# Altium schematic sheet Daughter_Card_Connectors.SchDoc
size A; SheetNumber: 7; SheetTotal: 7
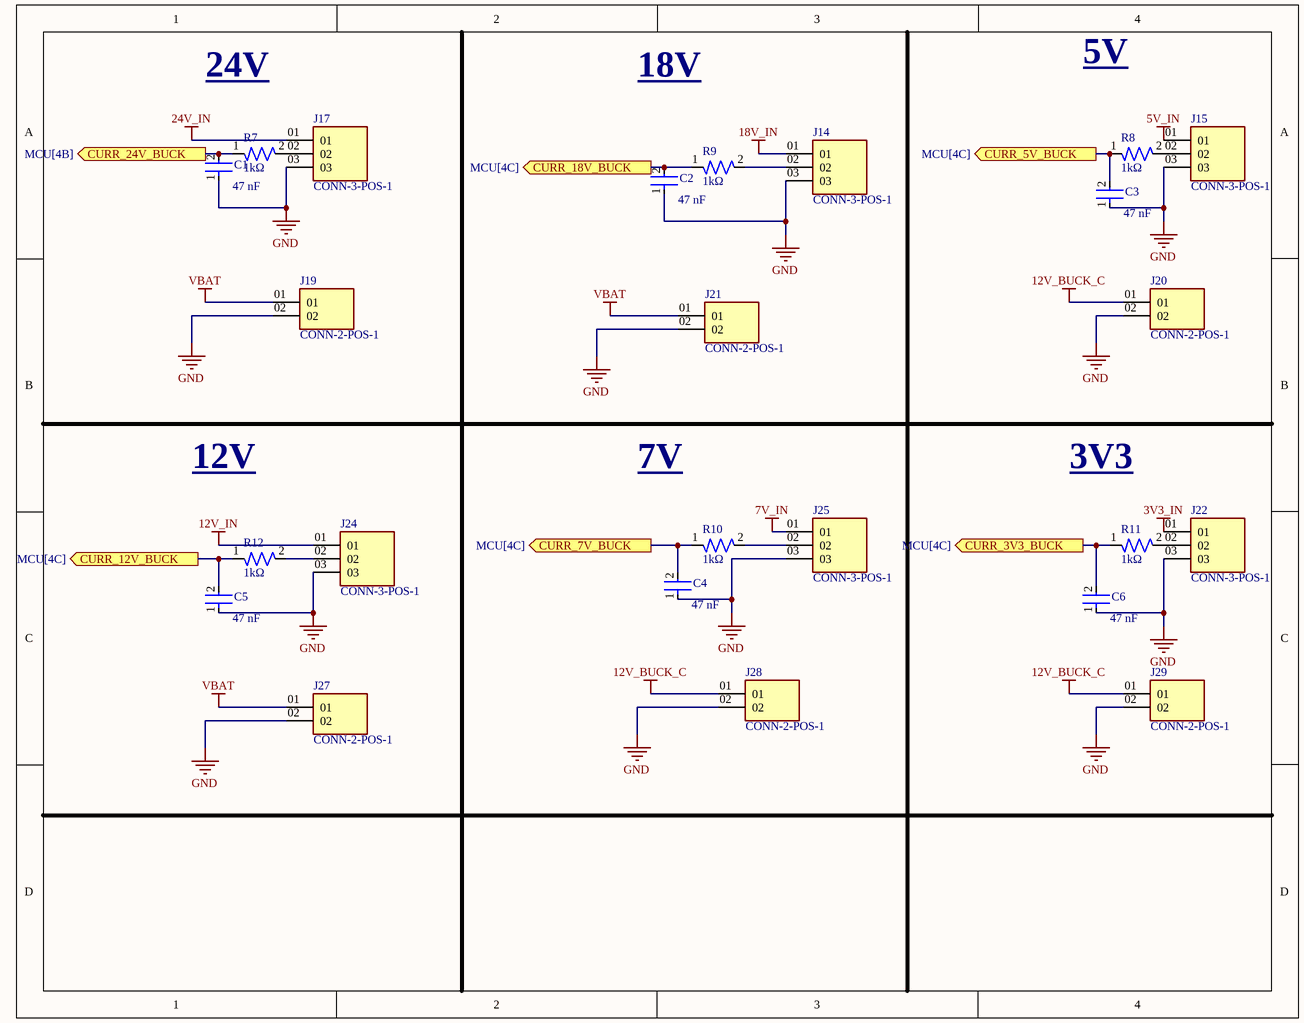
[diagram p0: Daughter_Card_Connectors.SchDoc]

## Parts
C1  Capacitance: 47 nF  [CAP-0603]  (hidden comment: GRM1885C1H302JA01D)
C2  Capacitance: 47 nF  [CAP-0603]  (hidden comment: GRM1885C1H302JA01D)
C3  Capacitance: 47 nF  [CAP-0603]  (hidden comment: GRM1885C1H302JA01D)
C4  Capacitance: 47 nF  [CAP-0603]  (hidden comment: GRM1885C1H302JA01D)
C5  Capacitance: 47 nF  [CAP-0603]  (hidden comment: GRM1885C1H302JA01D)
C6  Capacitance: 47 nF  [CAP-0603]  (hidden comment: GRM1885C1H302JA01D)
J14  CONN-3-POS-1  [SAMTEC_UMPS-03-03.5-L-V-S-W-TR]
J15  CONN-3-POS-1  [SAMTEC_UMPS-03-03.5-L-V-S-W-TR]
J17  CONN-3-POS-1  [SAMTEC_UMPS-03-03.5-L-V-S-W-TR]
J19  CONN-2-POS-1  [SAMTEC_UMPS-02-X-X-V-S-W-X]
J20  CONN-2-POS-1  [SAMTEC_UMPS-02-X-X-V-S-W-X]
J21  CONN-2-POS-1  [SAMTEC_UMPS-02-X-X-V-S-W-X]
J22  CONN-3-POS-1  [SAMTEC_UMPS-03-03.5-L-V-S-W-TR]
J24  CONN-3-POS-1  [SAMTEC_UMPS-03-03.5-L-V-S-W-TR]
J25  CONN-3-POS-1  [SAMTEC_UMPS-03-03.5-L-V-S-W-TR]
J27  CONN-2-POS-1  [SAMTEC_UMPS-02-X-X-V-S-W-X]
J28  CONN-2-POS-1  [SAMTEC_UMPS-02-X-X-V-S-W-X]
J29  CONN-2-POS-1  [SAMTEC_UMPS-02-X-X-V-S-W-X]
R7  Resistance: 1kΩ  [RES-0603]  (hidden comment: CRF2010-J/-000ELF)
R8  Resistance: 1kΩ  [RES-0603]  (hidden comment: CRF2010-J/-000ELF)
R9  Resistance: 1kΩ  [RES-0603]  (hidden comment: CRF2010-J/-000ELF)
R10  Resistance: 1kΩ  [RES-0603]  (hidden comment: CRF2010-J/-000ELF)
R11  Resistance: 1kΩ  [RES-0603]  (hidden comment: CRF2010-J/-000ELF)
R12  Resistance: 1kΩ  [RES-0603]  (hidden comment: CRF2010-J/-000ELF)

## Ports
CURR_3V3_BUCK (out, see MCU[4C]), CURR_5V_BUCK (out, see MCU[4C]), CURR_7V_BUCK (out, see MCU[4C]), CURR_12V_BUCK (out, see MCU[4C]), CURR_18V_BUCK (out, see MCU[4C]), CURR_24V_BUCK (out, see MCU[4B])

## Nets
3V3_IN: J22.01
5V_IN: J15.01
7V_IN: J25.01
12V_BUCK_C: J20.01 J28.01 J29.01
12V_IN: J24.01
18V_IN: J14.01
24V_IN: J17.01
GND: C1.1 C2.1 C3.1 C4.1 C5.1 C6.1 J14.03 J15.03 J17.03 J19.02 J20.02 J21.02 J22.03 J24.03 J25.03 J27.02 J28.02 J29.02
VBAT: J19.01 J21.01 J27.01
CURR_3V3_BUCK: C6.2 R11.1 ; port CURR_3V3_BUCK
CURR_5V_BUCK: C3.2 R8.1 ; port CURR_5V_BUCK
CURR_7V_BUCK: C4.2 R10.1 ; port CURR_7V_BUCK
CURR_12V_BUCK: C5.2 R12.1 ; port CURR_12V_BUCK
CURR_18V_BUCK: C2.2 R9.1 ; port CURR_18V_BUCK
CURR_24V_BUCK: C1.2 R7.1 ; port CURR_24V_BUCK
NetJ14_02: J14.02 R9.2
NetJ15_02: J15.02 R8.2
NetJ17_02: J17.02 R7.2
NetJ22_02: J22.02 R11.2
NetJ24_02: J24.02 R12.2
NetJ25_02: J25.02 R10.2

## Notes on the sheet
- 24V
- 18V
- 5V
- 12V
- 7V
- 3V3

## Library data of the parts
C1-C6 = CAP-3N-0001: 3000 pF ±5% 50V Ceramic Capacitor C0G, NP0 0603 (1608 Metric); Device Class: Ceramic; Size: 1210; ComponentLink1Description: Datasheet; ComponentLink1URL: https://mm.digikey.com/Volume0/opasdata/d220001/medias/docus/41/CL32B106KBJNNNE_Spec.pdf; Voltage: 50V
J14 J15 J17 J22 J24 J25 = CONN-3-POS-1: 3 Position Receptacle, Female Blade Sockets Connector Solder 0.079 (2.00mm) Surface Mount; MF: Samtec Inc.; MP: UMPS-03-03.5-L-V-S-W-TR; SnapEDA_Link: https://www.snapeda.com/parts/UMPS-03-03.5-L-V-S-W-TR/Samtec/view-part/?ref=snap; Package: None; Value: *; Check_prices: https://www.snapeda.com/parts/UMPS-03-03.5-L-V-S-W-TR/Samtec/view-part/?ref=eda
J19-J21 J27-J29 = CONN-2-POS-1: MF: SAMTEC; MP: UMPS-02-X-X-V-S-W-X; Package: None; Price: None; Value: *; Availability: Unavailable
R7-R12 = RES-0-0001: 0 Ohms Jumper Chip Resistor 2010 (5025 Metric) Automotive AEC-Q200 Metal Element; Tolerance: 1%; Size: 0603; ComponentLink1Description: Datasheet; ComponentLink1URL: https://www.yageo.com/upload/media/product/products/datasheet/rchip/PYu-RC_Group_51_RoHS_L_12.pdf